# Altium schematic sheet MCU-Power.SchDoc
size A4; SheetNumber: 3
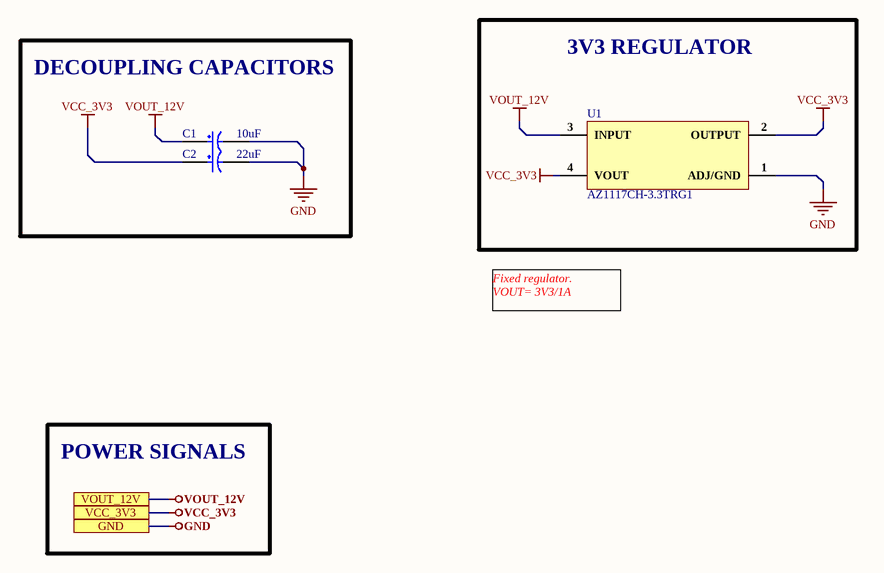
[diagram p0: MCU-Power.SchDoc]

## Parts
C1  10uF  [RVT1E100M0405.]
C2  22uF  [Cap Case-A]
U1  AZ1117CH-3.3TRG1  [AZ1117CH-3.3TRG1]

## Blocks framed on the sheet
DECOUPLING CAPACITORS: C1 C2
3V3 REGULATOR: U1

## Ports
GND, VCC_3V3, VOUT_12V

## Nets
GND: C1.2 C2.1 U1.1(ADJ/GND) ; port GND
VCC_3V3: C2.2 U1.2(OUTPUT) U1.4(VOUT) ; port VCC_3V3
VOUT_12V: C1.1 U1.3(INPUT) ; port VOUT_12V

## Notes on the sheet
- Fixed regulator.
  VOUT= 3V3/1A
- POWER SIGNALS

## Library data of the parts
C1 = RVT1E100M0405: CAP ALUM 10uF 25V SMD; Manufacturer: ROQANG; φD: 4mm; L: 5.4mm; Tolerance: ±20%; Operating Temperature: -45℃~+105℃; Rated Voltage: 25V; Capacitance: 10uF
C2 = CA45A-A-10V-22uF-K: 10V 22uF -55℃~+125℃ 6Ω 100kHz ±10% CASE-A_3216 Tantalum Capacitors ROHS; Manufacturer: CEC(Shenzhen Zhenhua XinYun Elec); Manufacturer Part No: CA45A-A-10V-22uF-K; Package: CASE-A_3216; Value: 22uF; ComponentLink1Description: LCSC; ComponentLink1URL: https://lcsc.com/product-detail/Tantalum-Capacitors_CEC-Shenzhen-Zhenhua-XinYun-Elec-CA45A-A-10V-22uF-K_C141745.html
U1 = AZ1117CH-3.3TRG1: 15V 1.3V @ 800mA Fixed 3.3V SOT-223 Linear Voltage Regulators (LDO) ROHS; Manufacturer: Diodes Incorporated; Value: Custom; Manufacturer Part No: AZ1117CH-3.3TRG1; Package: SOT-223